# Altium schematic sheet SPDIF-to-I2S-Sheet.SchDoc
size 420 x 297 mm; SheetNumber: 3; SheetTotal: 5
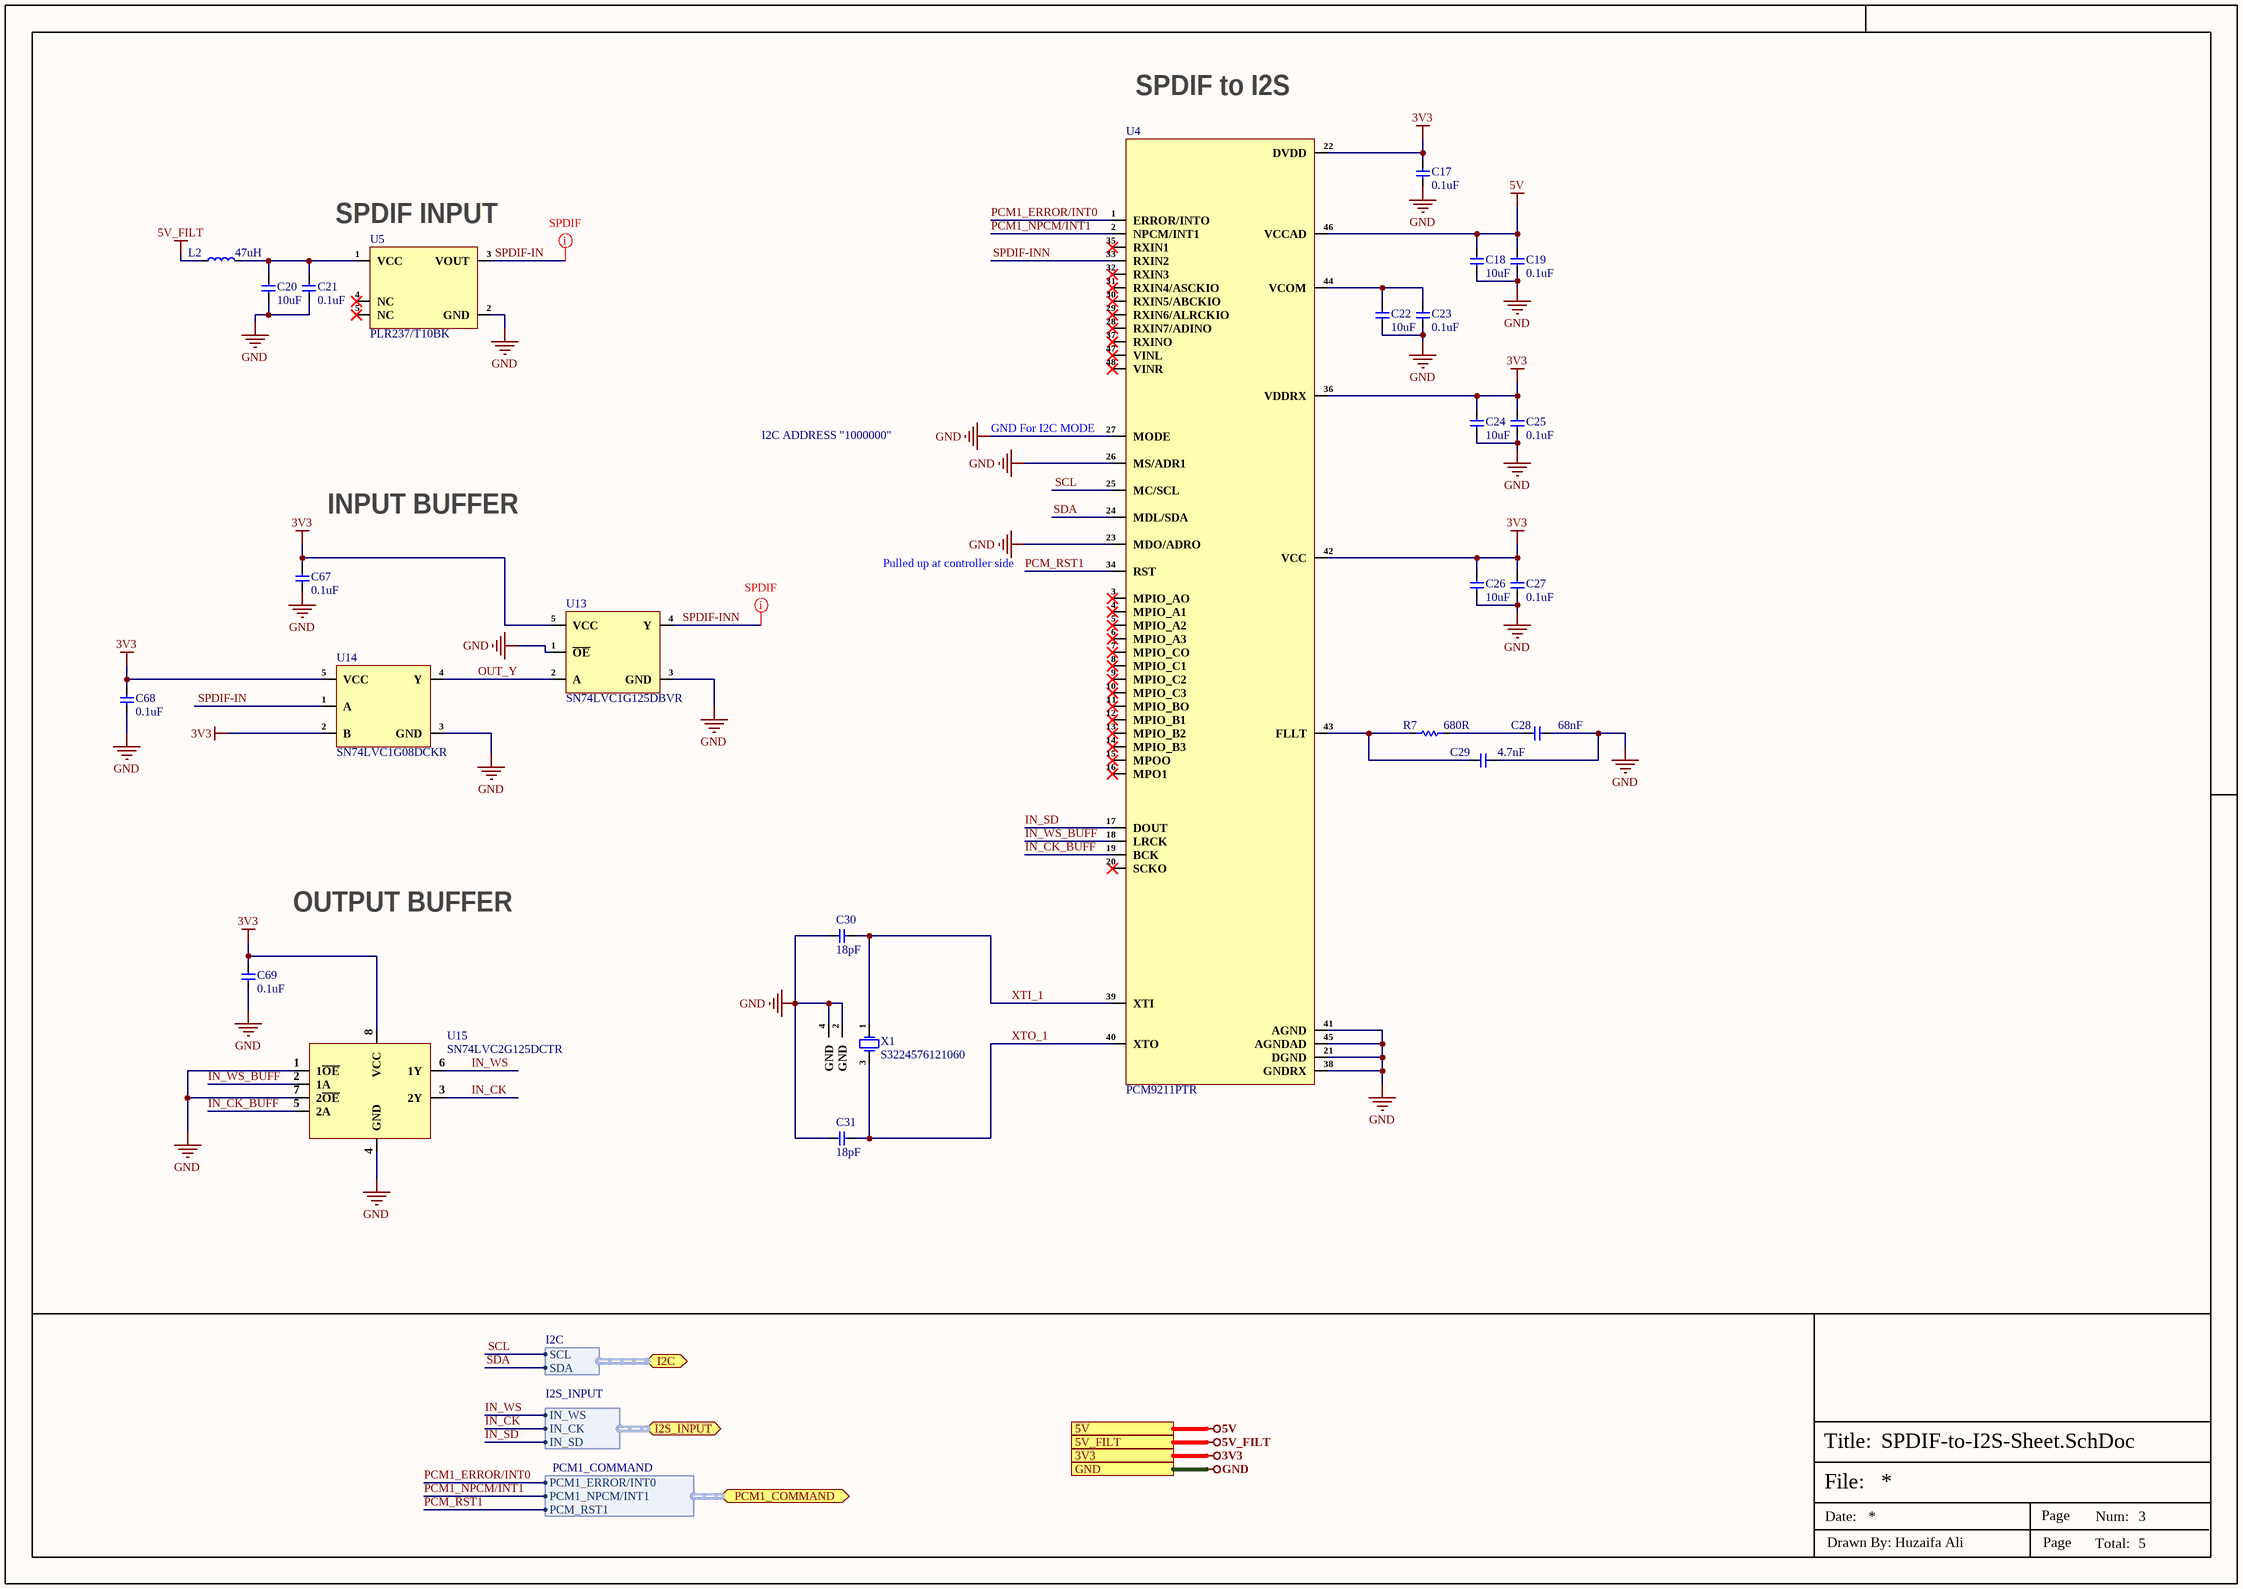
[diagram p0: SPDIF-to-I2S-Sheet.SchDoc]

## Parts
C17  0.1uF  [Cap-0402]
C18  10uF  [Cap-0402]
C19  0.1uF  [Cap-0402]
C20  10uF  [Cap-0402]
C21  0.1uF  [Cap-0402]
C22  10uF  [Cap-0402]
C23  0.1uF  [Cap-0402]
C24  10uF  [Cap-0402]
C25  0.1uF  [Cap-0402]
C26  10uF  [Cap-0402]
C27  0.1uF  [Cap-0402]
C28  68nF  [Cap-0402]
C29  4.7nF  [Cap-0402]
C30  18pF  [Cap-0402]
C31  18pF  [Cap-0402]
C67  0.1uF  [Cap-0402]
C68  0.1uF  [Cap-0402]
C69  0.1uF  [Cap-0402]
L2  47uH  [Ind-0805]
R7  680R  [Res-0402]
U4  PCM9211PTR  [48-LQFP (7x7)]
U5  PLR237/T10BK  [PLR237/T10BK]
U13  SN74LVC1G125DBVR  [SOT-23-5]
U14  SN74LVC1G08DCKR  [SC70-5]
U15  SN74LVC2G125DCTR  [SM8]
X1  S3224576121060  [S3224576121060_]

## Ports
3V3 (see Top_Sheet[2B], Controller-Sheet[2D], I2S-to-SPDIF-Sheet[3D], Power-Sheet[4D]), 5V (see Top_Sheet[2A], I2S-to-SPDIF-Sheet[3D], Power-Sheet[4D]), 5V_FILT (see Top_Sheet[2A], I2S-to-SPDIF-Sheet[3D], Power-Sheet[4D]), GND (see Top_Sheet[2B], Controller-Sheet[2D], I2S-to-SPDIF-Sheet[3D], Power-Sheet[4D]), I2C (bidir, harness I2C, see Top_Sheet[3B], Controller-Sheet[2D], I2S-to-SPDIF-Sheet[2D]), I2S_INPUT (bidir, harness I2S_INPUT, see Top_Sheet[3B], Controller-Sheet[3D]), PCM1_COMMAND (bidir, harness PCM1_COMMAND, see Top_Sheet[3B], Controller-Sheet[5D])

## Harnesses
I2C: SCL, SDA
I2S_INPUT: IN_WS, IN_CK, IN_SD
PCM1_COMMAND: PCM1_ERROR/INT0, PCM1_NPCM/INT1, PCM_RST1

## Nets
3V3: C17.2 C24.2 C25.2 C26.2 C27.2 C67.2 C68.2 C69.2 U4.22(DVDD) U4.36(VDDRX) U4.42(VCC) U13.5(VCC) U14.2(B) U14.5(VCC) U15.8(VCC) ; port 3V3
5V: C18.2 C19.2 U4.46(VCCAD) ; port 5V
5V_FILT: L2.1 ; port 5V_FILT
GND: C17.1 C18.1 C19.1 C20.1 C21.1 C22.1 C23.1 C24.1 C25.1 C26.1 C27.1 C28.2 C29.2 C30.1 C31.1 C67.1 C68.1 C69.1 U4.21(DGND) U4.23(MDO/ADRO) U4.26(MS/ADR1) U4.27(MODE) U4.38(GNDRX) U4.41(AGND) U4.45(AGNDAD) U5.2(GND) U13.1(~{OE}) U13.3(GND) U14.3(GND) U15.1(1~{OE}) U15.4(GND) U15.7(2~{OE}) X1.2(GND) X1.4(GND) ; port GND
IN_CK: U15.3(2Y) ; port I2S_INPUT.IN_CK
IN_CK_BUFF: U4.19(BCK) U15.5(2A)
IN_SD: U4.17(DOUT) ; port I2S_INPUT.IN_SD
IN_WS: U15.6(1Y) ; port I2S_INPUT.IN_WS
IN_WS_BUFF: U4.18(LRCK) U15.2(1A)
OUT_Y: U13.2(A) U14.4(Y)
PCM1_ERROR/INT0: U4.1(ERROR/INTO) ; port PCM1_COMMAND.PCM1_ERROR/INT0
PCM1_NPCM/INT1: U4.2(NPCM/INT1) ; port PCM1_COMMAND.PCM1_NPCM/INT1
PCM_RST1: U4.34(RST) ; port PCM1_COMMAND.PCM_RST1
SCL: U4.25(MC/SCL) ; port I2C.SCL
SDA: U4.24(MDL/SDA) ; port I2C.SDA
SPDIF-IN: U5.3(VOUT) U14.1(A)
SPDIF-INN: U4.33(RXIN2) U13.4(Y)
XTI_1: C30.2 U4.39(XTI) X1.1(OSC1)
XTO_1: C31.2 U4.40(XTO) X1.3(OSC2)
NetC20_2: C20.2 C21.2 L2.2 U5.1(VCC)
NetC22_2: C22.2 C23.2 U4.44(VCOM)
NetC28_1: C28.1 R7.2
NetC29_1: C29.1 R7.1 U4.43(FLLT)

Not connected (* = marked no-connect by the designer): U4 3(MPIO_AO)* 4(MPIO_A1)* 5(MPIO_A2)* 6(MPIO_A3)* 7(MPIO_CO)* 8(MPIO_C1)* 9(MPIO_C2)* 10(MPIO_C3)* 11(MPIO_BO)* 12(MPIO_B1)* 13(MPIO_B2)* 14(MPIO_B3)* 15(MPOO)* 16(MPO1)* 20(SCKO)* 28(RXIN7/ADINO)* 29(RXIN6/ALRCKIO)* 30(RXIN5/ABCKIO)* 31(RXIN4/ASCKIO)* 32(RXIN3)* 35(RXIN1)* 37(RXINO)* 47(VINL)* 48(VINR)*; U5 4(NC)* 5(NC)*

## Layout directives
net class SPDIF: SPDIF-IN, SPDIF-INN

## Notes on the sheet
- (near U4) SPDIF to I2S
- (near U5) SPDIF INPUT
- I2C ADDRESS "1000000"
- (near U4) GND For I2C MODE
- INPUT BUFFER
- Pulled up at controller side
- OUTPUT BUFFER
- File:
- Title:
- Date:
- Page
- Num:
- Total:
- Drawn By: Huzaifa Ali

## Library data of the parts
C17 C19 C21 C23 C25 C27 C67-C69 = CC0402KRX7R8BB104: CAP CER 0.1UF 25V X7R 0402; Manufacturer: Yageo; Tolerance: 10%; Capacitance: 100nF; Dissipation Factor: 3.5%; Supplier 1: Digi-Key; Manufacturer Part Number: CC0402KRX7R8BB104; RoHS: Yes; Category: Ceramic Capacitors; Stock 1: 1841009; Pricing 1: 1=0.10000, 10=0.03100, 50=0.01700, 100=0.01390, 500=0.00990, 1000=0.00777, 2500=0.00707, 5000=0.00650 (USD); Mount: Surface Mount; Case/Package: 0402; Case Code (Imperial): 0402; Case Code (Metric): 1005; Min Operating Temperature: -55°C; Max Operating Temperature: 125°C; Dielectric: X7R; Voltage Rating: 25V; Voltage Rating (DC): 25V; Packaging: Tape and Reel; Termination: SMD/SMT; Resistor Type: Ceramic; Length: 1mm; Width: 0.02inch; Height: 0.5mm; Thickness: 0.022inch; Depth: 0.5mm; Radiation Hardening: No; Lead Free: Lead Free; Halogen Free: Halogen Free; ComponentLink1URL: https://datasheet.ciiva.com/11464/upy-gphc-x7r-6-3v-to-50v-8-11464889.pdf?src-supplier=Avnet; ComponentLink1Description: https://datasheet.ciiva.com/11464/upy-gphc-x7r-6-3v-to-50v-8-11464889.pdf?src-supplier=Avnet; ComponentLink2URL: https://datasheet.ciiva.com/13210/upy-gphc-x7r-6-3v-to-50v-8-12304-13210908.pdf?src-supplier=Mouser; ComponentLink2Description: https://datasheet.ciiva.com/13210/upy-gphc-x7r-6-3v-to-50v-8-12304-13210908.pdf?src-supplier=Mouser; ComponentLink3URL: https://datasheet.ciiva.com/17437/upy-gphc-x7r-6-3v-to-50v-8-17437357.pdf?src-supplier=Avnet+Europe; ComponentLink3Description: https://datasheet.ciiva.com/17437/upy-gphc-x7r-6-3v-to-50v-8-17437357.pdf?src-supplier=Avnet+Europe; Supplier Part Number 1: 311-2077-1-ND; LCSC Part Number: C105883
C18 C20 C22 C24 C26 = CL05A106MP5NUNC: CAP CER 10UF 10V X5R 0402; Manufacturer: Samsung; Tolerance: 20%; Item Type: Capacitor; Supplier 1: Avnet; Manufacturer Part Number: CL05A106MP5NUNC; RoHS: Yes; Category: Ceramic Capacitors; Stock 1: 1729850; Pricing 1: 10000=0.02537 (USD); Mount: Surface Mount; Case/Package: 0402; Case Code (Metric): 1005; Case Code (Imperial): 0402; Contact Plating: Tin; Min Operating Temperature: -55°C; Max Operating Temperature: 85°C; Package Quantity: 1; Packaging: Tape and Reel; Capacitance: 10uF; Voltage Rating: 10V; Dielectric: X5R; Termination: Wraparound; Series: CL; Construction: Flat; Length: 1mm; Width: 0.02inch; Thickness: 0.028inch; Depth: 0.5mm; Radiation Hardening: No; Lead Free: Lead Free; RoHS Compliant: Yes; ComponentLink1URL: https://datasheet.ciiva.com/25721/cl05a106mp5nunc-25721584.pdf?src-supplier=Digi-Key; ComponentLink1Description: https://datasheet.ciiva.com/25721/cl05a106mp5nunc-25721584.pdf?src-supplier=Digi-Key; ComponentLink2URL: https://datasheet.ciiva.com/26838/getdatasheetpartid-745310-26838170.pdf?src-supplier=Verical; ComponentLink2Description: https://datasheet.ciiva.com/26838/getdatasheetpartid-745310-26838170.pdf?src-supplier=Verical; Supplier Part Number 1: CL05A106MP5NUNC; LCSC Part Number: C315248
C28 = CC0402KRX7R9BB683: CAP CER 0.068UF 50V X7R 0402; Manufacturer: Yageo; Dielectric: 1511DielectricType; Item Type: Capacitor; Supplier 1: Future Electronics; Manufacturer Part Number: CC0402KRX7R9BB683; RoHS: Yes; Category: Ceramic Capacitors; Stock 1: 100000; Pricing 1: 10000=0.0035, 40000=0.0033, 100000=0.0032, 250000=0.0031, 400000=0.0029 (USD); Case/Package: 343Case; Capacitance: 68nF; Voltage Rating (DC): 50V; Halogen Free: 5694HalogenFree; Lead Free: 5697LeadFree; Supplier Part Number 1: 2106471
C29 = CC0402KRX7R9BB472: CAP CER 4700PF 50V X7R 0402; Manufacturer: Yageo; Material: 4241ConductorMaterial; Tolerance: 10%; Temperature Coefficient: 30ppm/°C; Item Type: Capacitor; Supplier 1: Future Electronics; Manufacturer Part Number: CC0402KRX7R9BB472; RoHS: Yes; Category: Ceramic Capacitors; Stock 1: 1780000; Pricing 1: 10000=0.0021, 40000=0.002, 150000=0.0019, 400000=0.0018, 1000000=0.0017 (USD); Mount: Surface Mount; Case/Package: 0402; Number of Pins: 2NUMBER; Case Code (Imperial): 0402; Case Code (Metric): 1005; Min Operating Temperature: -55°C; Max Operating Temperature: 125°C; Capacitance: 4.7nF; Dielectric: X7R; Voltage Rating: 50V; Voltage Rating (DC): 50V; Packaging: Tape and Reel; Package Quantity: 1; Termination: SMD/SMT; Series: CC; Construction: Flat; Length: 1mm; Width: 0.02inch; Height: 0.5mm; Thickness: 0.022inch; Depth: 0.5mm; Radiation Hardening: No; Reach SVHC Compliant: No; RoHS Compliant: Yes; Halogen Free: 5694HalogenFree; Lead Free: 5697LeadFree; ComponentLink1URL: https://datasheet.ciiva.com/7978/1489800-7978108.pdf?src-supplier=Element14; ComponentLink1Description: https://datasheet.ciiva.com/7978/1489800-7978108.pdf?src-supplier=Element14; ComponentLink2URL: https://datasheet.ciiva.com/176/mlccorderingcode-176364.pdf?src-supplier=Digikey; ComponentLink2Description: https://datasheet.ciiva.com/176/mlccorderingcode-176364.pdf?src-supplier=Digikey; ComponentLink3URL: https://datasheet.ciiva.com/176/mlccorderingcode-176363.pdf?src-supplier=Digikey; ComponentLink3Description: https://datasheet.ciiva.com/176/mlccorderingcode-176363.pdf?src-supplier=Digikey; ComponentLink4URL: https://datasheet.ciiva.com/176/mlccorderingcode-176365.pdf?src-supplier=Digikey; ComponentLink4Description: https://datasheet.ciiva.com/176/mlccorderingcode-176365.pdf?src-supplier=Digikey; ComponentLink5URL: https://datasheet.ciiva.com/11586/upy-gphc-x7r-6-3v-to-50v-8-11586491.pdf?src-supplier=Avnet; ComponentLink5Description: https://datasheet.ciiva.com/11586/upy-gphc-x7r-6-3v-to-50v-8-11586491.pdf?src-supplier=Avnet; Supplier Part Number 1: 1989300
C30 C31 = GCM1555C1H180GA16D: CAP CER 18PF 50V C0G/NP0 0402; Manufacturer: Murata; Tolerance: 2%; Item Type: Capacitor; Supplier: Rs; Supplier Part Number: 2477793P; Manufacturer Part Number: GCM1555C1H180GA16D; RoHS: Yes; Category: Ceramic Capacitors; Stock: 10000; Pricing: 500=0.013, 5000=0.009 (GBP); Mounting Technology: Surface Mount; Case/Package: 0402; Case Code (Imperial): 0402; Case Code (Metric): 1005; Min Operating Temperature: -55°C; Max Operating Temperature: 125°C; Packaging: Cut Tape; Value: 18pF; Voltage Rating: 50V; Series: GCM; Ratings: AEC-Q200; RoHS Compliant: Yes; ComponentLink1URL: http://search.murata.co.jp/Ceramy/image/img/A01X/G101/ENG/GCM1555C1H180GA16-01.pdf?src-supplier=Digi-Key; ComponentLink1Description: http://search.murata.co.jp/Ceramy/image/img/A01X/G101/ENG/GCM1555C1H180GA16-01.pdf?src-supplier=Digi-Key; ComponentLink2URL: https://search.murata.co.jp/Ceramy/image/img/A01X/G101/ENG/GCM1555C1H180GA16-01.pdf?src-supplier=Digi-Key; ComponentLink2Description: https://search.murata.co.jp/Ceramy/image/img/A01X/G101/ENG/GCM1555C1H180GA16-01.pdf?src-supplier=Digi-Key; ComponentLink3URL: https://datasheet.octopart.com/GCM1555C1H180GA16D-Murata-datasheet-149522315.pdf?src-supplier=Newark; ComponentLink3Description: https://datasheet.octopart.com/GCM1555C1H180GA16D-Murata-datasheet-149522315.pdf?src-supplier=Newark; ComponentLink4URL: https://datasheet.octopart.com/GCM1555C1H180GA16D-Murata-datasheet-12511495.pdf?src-supplier=TME; ComponentLink4Description: https://datasheet.octopart.com/GCM1555C1H180GA16D-Murata-datasheet-12511495.pdf?src-supplier=TME; LCSC Part Number: C882583
L2 = MLW2012RF-470MT: 280mA 47uH ±20% 3.4Ω 0805 Inductors (SMD) ROHS; Manufacturer: MetalLions; Manufacturer Part Number: MLW2012RF-470MT; Package: 0805; LCSC Part Number: C2844637; Item Type: Inductor; ComponentLink1Description: LCSC; ComponentLink1URL: https://www.lcsc.com/product-detail/Inductors-SMD_MetalLions-MLW2012RF-470MT_C2844637.html
R7 = RC0402FR-07680RL: RES 680 OHM 1% 1/16W 0402; Manufacturer: Yageo; Temperature Coefficient: 100ppm/°C; Power Rating: 63mW; Voltage Rating: 50V; Item Type: Resistor; Supplier 1: Future Electronics; Manufacturer Part Number: RC0402FR-07680RL; RoHS: Yes; Category: Chip SMD Resistors; Stock 1: 5080000; Pricing 1: 10000=0.0011, 100000=0.0011, 300000=0.001, 750000=0.001, 2000000=0.0009 (USD); Case/Package: 0402; Case Code (Imperial): 0402; Case Code (Metric): 1005; Size Code: 0402; Min Operating Temperature: -55°C; Max Operating Temperature: 155°C; Resistance: 680R; Tolerance: 1%; Packaging: Tape and Reel; Resistor Type: Thick Film; Termination: SMD/SMT; Features: Moisture Resistant; Series: RC; Max Power Dissipation: 63mW; Number of Terminations: 2; Resistance Tolerance: 1%; Construction: Rectangular; Voltage Rating (AC): 50V; Length: 1mm; Depth: 0.5mm; Reach SVHC Compliant: No; Lead Free: Lead Free; Military Standard: Not; RoHS Compliant: Yes; ComponentLink1URL: https://datasheet.ciiva.com/12667/pyu-rc0402-51-rohs-l-6-r-12667916.pdf?src-supplier=Mouser; ComponentLink1Description: https://datasheet.ciiva.com/12667/pyu-rc0402-51-rohs-l-6-r-12667916.pdf?src-supplier=Mouser; ComponentLink2URL: https://datasheet.ciiva.com/7850/1018594-7850071.pdf?src-supplier=Element14; ComponentLink2Description: https://datasheet.ciiva.com/7850/1018594-7850071.pdf?src-supplier=Element14; ComponentLink3URL: https://datasheet.ciiva.com/7850/1018594-7850070.pdf?src-supplier=Element14; ComponentLink3Description: https://datasheet.ciiva.com/7850/1018594-7850070.pdf?src-supplier=Element14; ComponentLink4URL: https://datasheet.ciiva.com/17042/pyu-rc0402-51-rohs-l-6-r-17042399.pdf?src-supplier=Future+Electronics; ComponentLink4Description: https://datasheet.ciiva.com/17042/pyu-rc0402-51-rohs-l-6-r-17042399.pdf?src-supplier=Future+Electronics; Supplier Part Number 1: 7948052
U4 = PCM9211PTR: IC AUDIO TRANSCEIVER 48LQFP; Manufacturer: Texas Instruments; Item Type: Amplifiers - Audio; Supplier: Mouser; Supplier Part Number: 595-PCM9211PTR; Manufacturer Part Number: PCM9211PTR; RoHS: Yes; Stock: 2280; Pricing: 1=3.06, 10=2.74, 50=2.74, 100=2.51, 1000=1.8, 10000=1.49 (USD); ComponentLink1URL: https://datasheet.ciiva.com/1825/pcm9211-1825949.pdf?src-supplier=Digikey; ComponentLink1Description: https://datasheet.ciiva.com/1825/pcm9211-1825949.pdf?src-supplier=Digikey; ComponentLink2URL: https://datasheet.ciiva.com/3026/sbas495-3026720.pdf?src-supplier=Avnet; ComponentLink2Description: https://datasheet.ciiva.com/3026/sbas495-3026720.pdf?src-supplier=Avnet; ComponentLink3URL: https://datasheet.ciiva.com/1825/pcm9211-1825950.pdf?src-supplier=Digikey; ComponentLink3Description: https://datasheet.ciiva.com/1825/pcm9211-1825950.pdf?src-supplier=Digikey; ComponentLink4URL: https://datasheet.ciiva.com/1825/pcm9211-1825951.pdf?src-supplier=Digikey; ComponentLink4Description: https://datasheet.ciiva.com/1825/pcm9211-1825951.pdf?src-supplier=Digikey
U5 = PLR237/T10BK: FIBER OPTIC RECEIVER IR; Manufacturer: Everlight; Supplier: Digikey; Supplier Part Number: 1080-PLR237/T10BK-ND; Manufacturer Part Number: PLR237/T10BK; RoHS: No; Item Type: FIBER OPTIC RECEIVER; Stock: 4654; Pricing: 1=3.86, 60=2.727, 120=2.2335, 540=1.88291, 1020=1.72708, 2040=1.65566, 5040=1.6232 (USD); LCSC Part Number: C17427482
U13 = SN74LVC1G125DBVR: IC BUFF NON-INVERT 5.5V SOT23-5; Manufacturer: Texas Instruments; Item Type: Buffers, Drivers and Transceivers; Number of Elements: 1; Logic Function: Buffer,Inverting; High Level Output Current: 32mA; Polarity: Non-Inverting; Output Type: 3-STATE; Min Supply Voltage: 1.65V; Propagation Delay: 4ns; Quiescent Current: 10uA; Supplier 1: Mouser; Manufacturer Part Number: SN74LVC1G125DBVR; RoHS: Yes; Stock 1: 237997; Pricing 1: 1=0.36, 10=0.243, 50=0.243, 100=0.102, 1000=0.07, 10000=0.037 (USD); Mount: Surface Mount; Case/Package: SOT-23-5; Weight: 0.001446oz; Min Operating Temperature: -40°C; Max Operating Temperature: 125°C; Packaging: Tape and Reel; Package Quantity: 3000; Number of Bits per Element: 1; Low Level Output Current: 32mA; Number of Gates: 1; Number of Bits: 1; Series: 74LVC; Max Supply Voltage: 5.5V; Number of Channels: 1; Technology: CMOS; Number of Input Lines: 1; Number of Output Lines: 1; Number of Circuits: 1; Max Supply Current: 10uA; Length: 2.9mm; Width: 1.6mm; Height: 1.15mm; Lead Free: Lead Free; RoHS Compliant: Yes; Supplier Part Number 1: 595-SN74LVC1G125DBVR
U14 = SN74LVC1G08DCKR: IC GATE AND 1CH 2-INP SC70-5; Manufacturer: Texas Instruments; Item Type: Logic Gates; Propagation Delay: 4ns; Number of Gates: 1; Logic Function: AND GATE; Min Supply Voltage: 1.65V; Max Supply Voltage: 5.5V; Output Current: 32mA; Number of Inputs: 2; Quiescent Current: 10uA; High Level Output Current: -32mA; Turn-On Delay Time: 4.5ns; Number of Channels: 1NUMBER; Schmitt Trigger Input: No; Supplier 1: Mouser; Manufacturer Part Number: SN74LVC1G08DCKR; RoHS: Yes; Stock 1: 509262; Pricing 1: 1=0.33, 10=0.228, 50=0.228, 100=0.095, 1000=0.065, 10000=0.035 (USD); Mount: Surface Mount; Case/Package: SC; Number of Pins: 5; Weight: 8.8E-05oz; Min Operating Temperature: -40°C; Max Operating Temperature: 125°C; Packaging: Tape and Reel; Number of Bits: 1; Number of Outputs: 1; Number of Input Lines: 2; Number of Output Lines: 1; Low Level Output Current: 32mA; Number of Circuits: 1; Number of Elements: 1; Series: 74LVC; Technology: CMOS; Max Output Current: 32mA; Termination: SMD/SMT; Length: 2.15mm; Width: 1.4mm; Height: 1mm; Thickness: 900um; Radiation Hardening: No; Reach SVHC Compliant: No; Lead Free: Lead Free; RoHS Compliant: Yes; ComponentLink1URL: https://datasheet.ciiva.com/14290/sn74lvc1g08-14290720.pdf?src-supplier=Avnet; ComponentLink1Description: https://datasheet.ciiva.com/14290/sn74lvc1g08-14290720.pdf?src-supplier=Avnet; ComponentLink2URL: https://datasheet.ciiva.com/28540/1772545-28540798.pdf?src-supplier=Element14; ComponentLink2Description: https://datasheet.ciiva.com/28540/1772545-28540798.pdf?src-supplier=Element14; ComponentLink3URL: https://datasheet.ciiva.com/1864/sn74lvc1g08-1864342.pdf?src-supplier=Digikey; ComponentLink3Description: https://datasheet.ciiva.com/1864/sn74lvc1g08-1864342.pdf?src-supplier=Digikey; ComponentLink4URL: https://datasheet.ciiva.com/1864/sn74lvc1g08-1864341.pdf?src-supplier=Digikey; ComponentLink4Description: https://datasheet.ciiva.com/1864/sn74lvc1g08-1864341.pdf?src-supplier=Digikey; ComponentLink5URL: https://datasheet.ciiva.com/1864/sn74lvc1g08-1864343.pdf?src-supplier=Digikey; ComponentLink5Description: https://datasheet.ciiva.com/1864/sn74lvc1g08-1864343.pdf?src-supplier=Digikey; ComponentLink6URL: https://datasheet.ciiva.com/14290/sn74lvc1g08-14290717.pdf?src-supplier=Avnet; ComponentLink6Description: https://datasheet.ciiva.com/14290/sn74lvc1g08-14290717.pdf?src-supplier=Avnet; Supplier Part Number 1: 595-SN74LVC1G08DCKR; LCSC Part Number: C7832
U15 = SN74LVC2G125DCTR: IC BUFFER NON-INVERT 5.5V SM8; Manufacturer: Texas Instruments; Nominal Supply Current: 10uA; Number of Circuits: 1NUMBER; Supplier 1: Mouser; Manufacturer Part Number: SN74LVC2G125DCTR; RoHS: Yes; Item Type: IC; Stock 1: 14743; Pricing 1: 1=0.52, 10=0.427, 50=0.427, 100=0.316, 1000=0.241, 10000=0.19 (USD); Thickness: 1.29mm; ComponentLink1URL: https://datasheet.ciiva.com/7744/1781747-7744021.pdf?src-supplier=Element14; ComponentLink1Description: https://datasheet.ciiva.com/7744/1781747-7744021.pdf?src-supplier=Element14; ComponentLink2URL: https://datasheet.ciiva.com/7744/1781747-7744022.pdf?src-supplier=Element14; ComponentLink2Description: https://datasheet.ciiva.com/7744/1781747-7744022.pdf?src-supplier=Element14; Supplier Part Number 1: 595-SN74LVC2G125DCTR; LCSC Part Number: C206035
X1 = S3224576121060: 24.576MHz SMD Crystal Resonator 12pF 60Ω ±10ppm -40℃~+85℃ SMD3225-4P Crystals ROHS; Manufacturer: JGHC; Manufacturer Part Number: S3224576121060; Footprint: Custom; ComponentLink1Description: LCSC; ComponentLink1URL: https://lcsc.com/product-detail/Crystals_JGHC-S3224576121060_C390772.html; Value: 24.576MHz; LCSC Part Number: C390772